# Altium schematic sheet tc264-Main.SchDoc
size A3; SheetNumber: 1; SheetTotal: 3
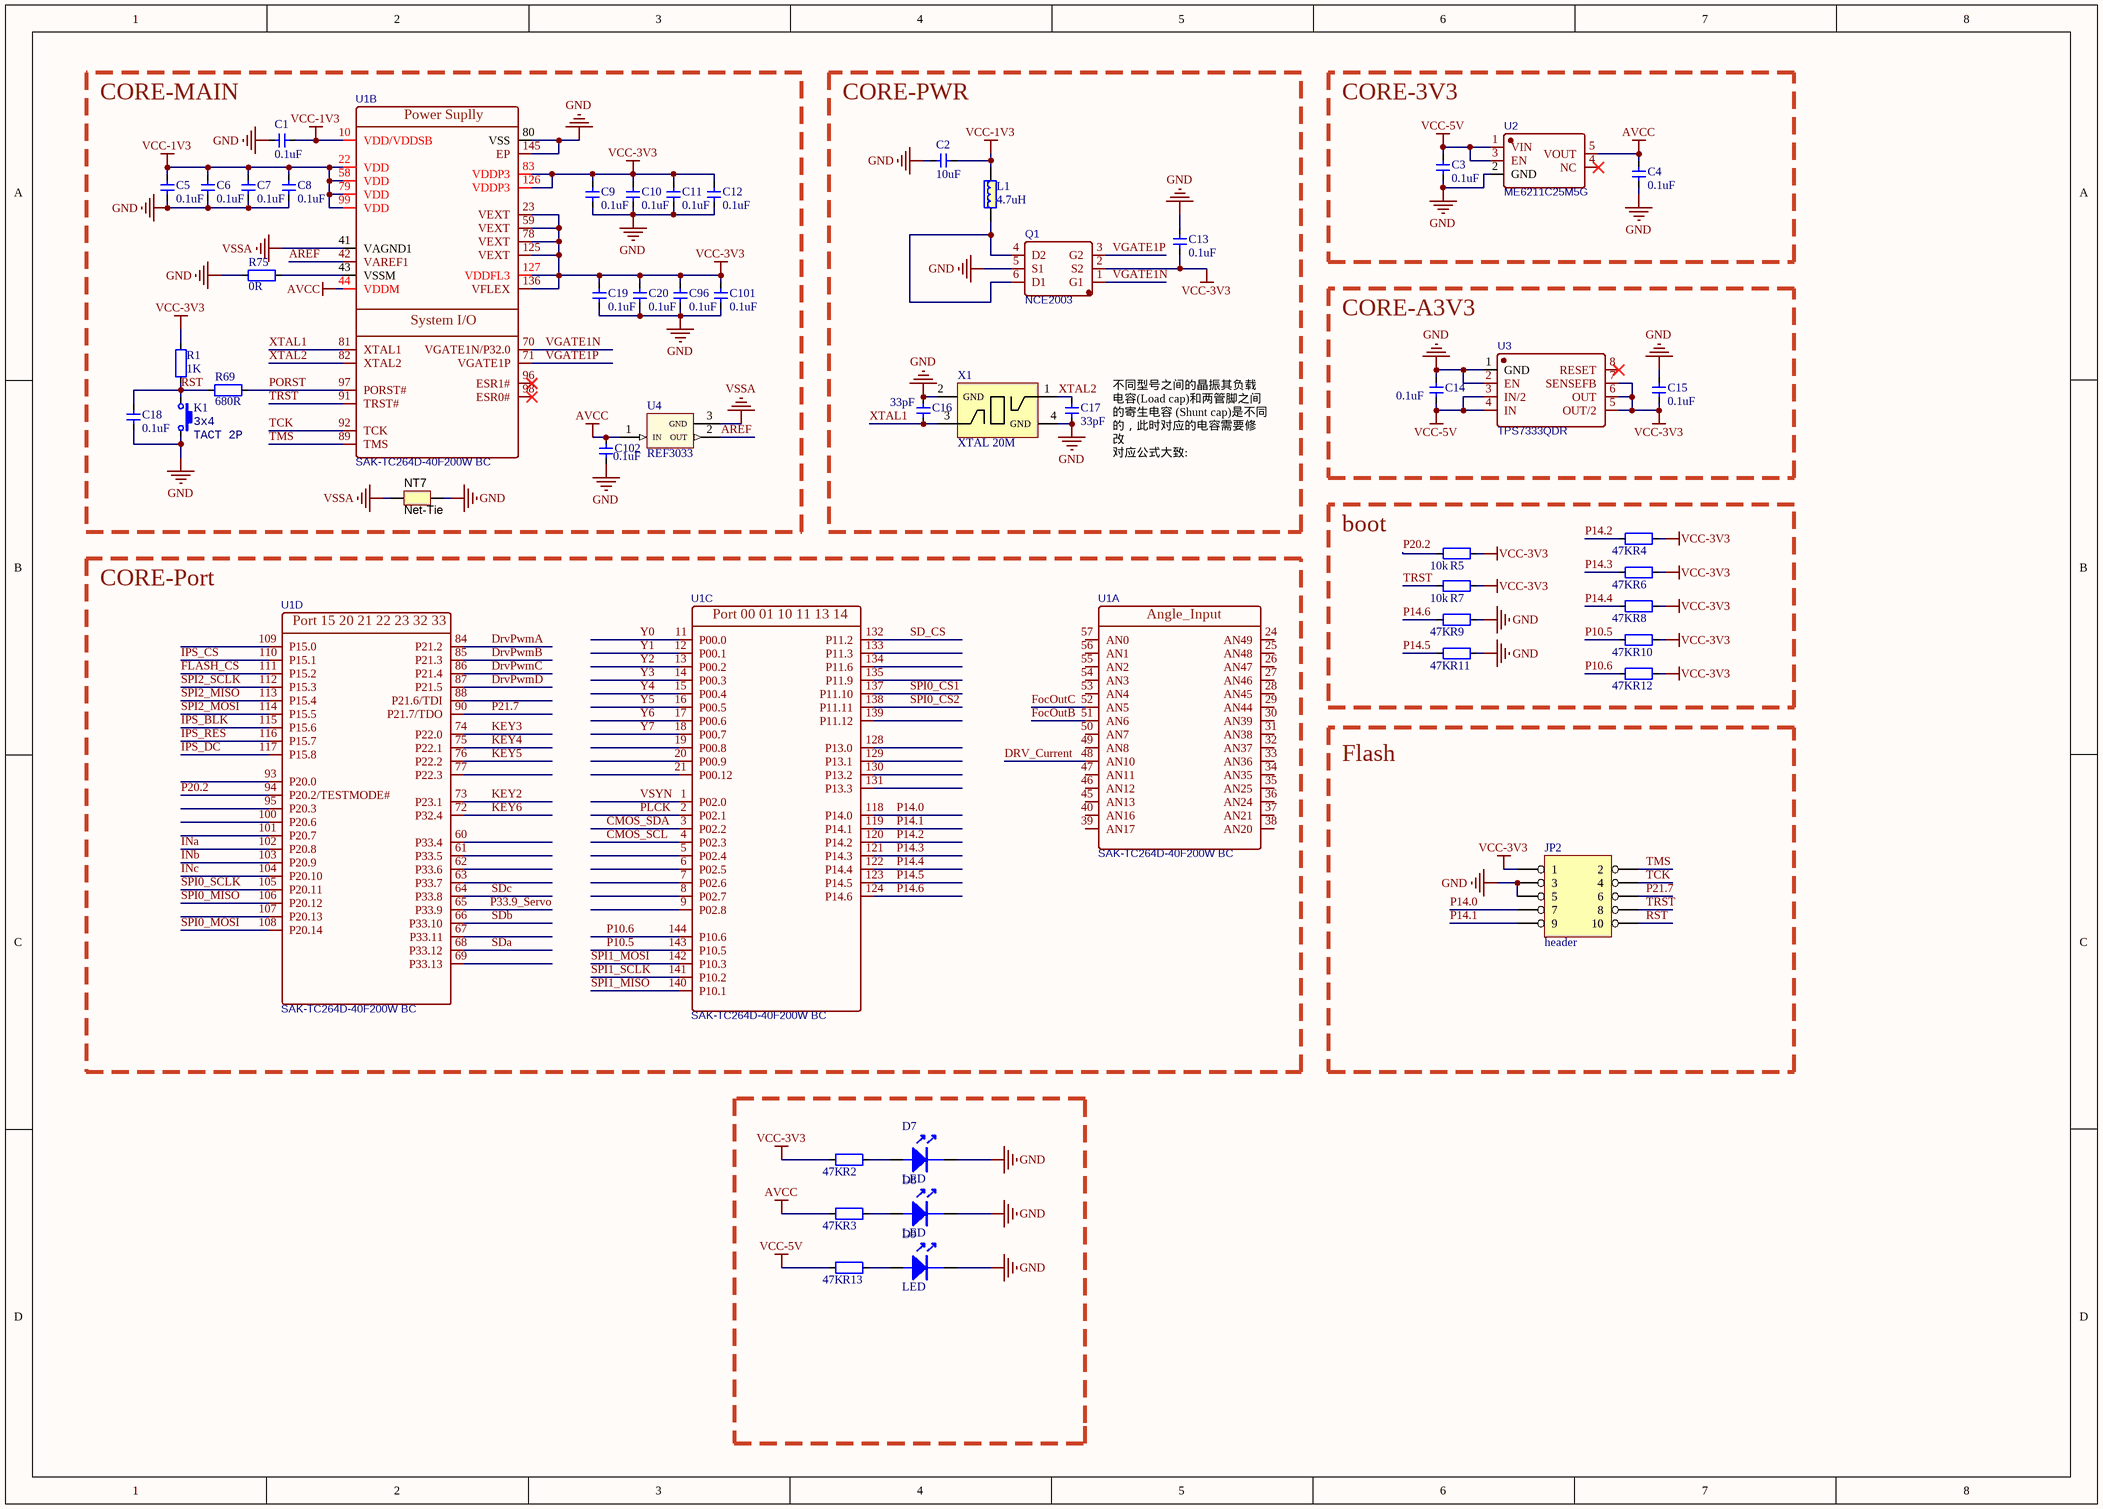
[diagram p0: tc264-Main.SchDoc]

## Parts
C1  0.1uF  [0603-CAP]
C2  10uF  [0603-CAP]
C3  0.1uF  [0603-CAP]
C4  0.1uF  [0603-CAP]
C5  0.1uF  [0603-CAP]
C6  0.1uF  [0603-CAP]
C7  0.1uF  [0603-CAP]
C8  0.1uF  [0603-CAP]
C9  0.1uF  [0603-CAP]
C10  0.1uF  [0603-CAP]
C11  0.1uF  [0603-CAP]
C12  0.1uF  [0603-CAP]
C13  0.1uF  [1206-CAP]
C14  0.1uF  [0603-CAP]
C15  0.1uF  [0603-CAP]
C16  33pF  [0603-CAP]
C17  33pF  [0603-CAP]
C18  0.1uF  [0603-CAP]
C19  0.1uF  [0603-CAP]
C20  0.1uF  [0603-CAP]
C96  0.1uF  [0603-CAP]
C101  0.1uF  [0603-CAP]
C102  0.1uF  [0603-CAP]
D7  LED  [0603_LED]
D8  LED  [0603_LED]
D9  LED  [0603_LED]
JP2  header  [header2X5]
K1  value 3x4  [ButtonTACT_3x4x2_180H]  (hidden comment: TACT 2P)
L1  4.7uH  [IND-201612]
NT7  Net-Tie  [Net-Tie_6mil]  (net tie, no BOM)
Q1  NCE2003  [SOT23-6 - duplicate]
R1  1K  [0603_R]
R2  47K  [0603_R]
R3  47K  [0603_R]
R4  47K  [0603_R]
R5  10k  [0603_R]
R6  47K  [0603_R]
R7  10k  [0603_R]
R8  47K  [0603_R]
R9  47K  [0603_R]
R10  47K  [0603_R]
R11  47K  [0603_R]
R12  47K  [0603_R]
R13  47K  [0603_R]
R69  680R  [0603_R]
R75  0R  [0603_R]
U1  SAK-TC264D-40F200W BC  [EQFP144_M]  (parts A,B,C,D of 4)
U2  ME6211C25M5G  [SOT23-5]
U3  TPS7333QDR  [SOIC-8]
U4  REF3033  [DBZ3]
X1  XTAL 20M  [OSC_KH3225_4P]

## Blocks framed on the sheet
CORE-MAIN: C1 C5-C12 C18-C20 C96 C101 C102 K1 NT7 R1 R69 R75 U1 U4
CORE-PWR: C2 C13 C16 C17 L1 Q1 X1
CORE-3V3: C3 C4 U2
CORE-A3V3: C14 C15 U3
CORE-Port: U1
boot: R4-R12
Flash: JP2

## Nets
AVCC: C4.2 C102.2 R3.2 U1.44(VDDM) U2.5(VOUT) U4.1(IN)
GND: C1.2 C2.2 C3.1 C4.1 C5.1 C6.1 C7.1 C8.1 C9.1 C10.1 C11.1 C12.1 C13.2 C14.2 C15.2 C16.2 C17.1 C18.2 C19.1 C20.1 C96.1 C101.1 C102.1 D7.2(K) D8.2(K) D9.2(K) JP2.3 JP2.5 K1.2 NT7.2 Q1.5(S1) R9.1 R11.1 R75.1 U1.80(VSS) U1.145(EP) U2.2(GND) U3.1(GND) U3.2(EN) X1.2(GND) X1.4(GND)
VCC-1V3: C1.1 C2.1 C5.2 C6.2 C7.2 C8.2 L1.2 U1.10(VDD/VDDSB) U1.22(VDD) U1.58(VDD) U1.79(VDD) U1.99(VDD)
VCC-3V3: C9.2 C10.2 C11.2 C12.2 C13.1 C15.1 C19.2 C20.2 C96.2 C101.2 JP2.1 Q1.2(S2) R1.2 R2.2 R4.1 R5.1 R6.1 R7.1 R8.1 R10.1 R12.1 U1.23(VEXT) U1.59(VEXT) U1.78(VEXT) U1.83(VDDP3) U1.125(VEXT) U1.126(VDDP3) U1.127(VDDFL3) U1.136(VFLEX) U3.5(OUT/2) U3.6(OUT) U3.7(SENSEFB)
VCC-5V: C3.2 C14.1 R13.2 U2.1(VIN) U2.3(EN) U3.3(IN/2) U3.4(IN)
VSSA: NT7.1 U1.41(VAGND1) U4.3(GND)
AREF: U1.42(VAREF1) U4.2(OUT)
CMOS_SCL: U1.4(P02.3)
CMOS_SDA: U1.3(P02.2)
DRV_Current: U1.48(AN10)
DrvPwmA: U1.84(P21.2)
DrvPwmB: U1.85(P21.3)
DrvPwmC: U1.86(P21.4)
DrvPwmD: U1.87(P21.5)
FLASH_CS: U1.111(P15.2)
FocOutB: U1.51(AN6)
FocOutC: U1.52(AN5)
INa: U1.102(P20.8)
INb: U1.103(P20.9)
INc: U1.104(P20.10)
IPS_BLK: U1.115(P15.6)
IPS_CS: U1.110(P15.1)
IPS_DC: U1.117(P15.8)
IPS_RES: U1.116(P15.7)
KEY2: U1.73(P23.1)
KEY3: U1.74(P22.0)
KEY4: U1.75(P22.1)
KEY5: U1.76(P22.2)
KEY6: U1.72(P32.4)
P10.5: R10.2 U1.143(P10.5)
P10.6: R12.2 U1.144(P10.6)
P14.0: JP2.7 U1.118(P14.0)
P14.1: JP2.9 U1.119(P14.1)
P14.2: R4.2 U1.120(P14.2)
P14.3: R6.2 U1.121(P14.3)
P14.4: R8.2 U1.122(P14.4)
P14.5: R11.2 U1.123(P14.5)
P14.6: R9.2 U1.124(P14.6)
P20.2: R5.2 U1.94(P20.2/TESTMODE#)
P21.7: JP2.6 U1.90(P21.7/TDO)
P33.9_Servo: U1.65(P33.9)
PLCK: U1.2(P02.1)
PORST: R69.2 U1.97(PORST#)
RST: C18.1 JP2.10 K1.1 R1.1 R69.1
SD_CS: U1.132(P11.2)
SDa: U1.68(P33.12)
SDb: U1.66(P33.10)
SDc: U1.64(P33.8)
SPI0_CS1: U1.137(P11.10)
SPI0_CS2: U1.138(P11.11)
SPI0_MISO: U1.106(P20.12)
SPI0_MOSI: U1.108(P20.14)
SPI0_SCLK: U1.105(P20.11)
SPI1_MISO: U1.140(P10.1)
SPI1_MOSI: U1.142(P10.3)
SPI1_SCLK: U1.141(P10.2)
SPI2_MISO: U1.113(P15.4)
SPI2_MOSI: U1.114(P15.5)
SPI2_SCLK: U1.112(P15.3)
TCK: JP2.4 U1.92(TCK)
TMS: JP2.2 U1.89(TMS)
TRST: JP2.8 R7.2 U1.91(TRST#)
VGATE1N: Q1.1(G1) U1.70(VGATE1N/P32.0)
VGATE1P: Q1.3(G2) U1.71(VGATE1P)
VSYN: U1.1(P02.0)
XTAL1: C16.1 U1.81(XTAL1) X1.3(OSC2)
XTAL2: C17.2 U1.82(XTAL2) X1.1(OSC1)
Y0: U1.11(P00.0)
Y1: U1.12(P00.1)
Y2: U1.13(P00.2)
Y3: U1.14(P00.3)
Y4: U1.15(P00.4)
Y5: U1.16(P00.5)
Y6: U1.17(P00.6)
Y7: U1.18(P00.7)
NetD7_1: D7.1(A) R2.1
NetD8_1: D8.1(A) R3.1
NetD9_1: D9.1(A) R13.1
NetL1_1: L1.1 Q1.4(D2) Q1.6(D1)
NetR75_2: R75.2 U1.43(VSSM)

Not connected (* = marked no-connect by the designer): U1 5(P02.4) 6(P02.5) 7(P02.6) 8(P02.7) 9(P02.8) 19(P00.8) 20(P00.9) 21(P00.12) 24(AN49) 25(AN48) 26(AN47) 27(AN46) 28(AN45) 29(AN44) 30(AN39) 31(AN38) 32(AN37) 33(AN36) 34(AN35) 35(AN25) 36(AN24) 37(AN21) 38(AN20) 39(AN17) 40(AN16) 45(AN13) 46(AN12) 47(AN11) 49(AN8) 50(AN7) 53(AN4) 54(AN3) 55(AN2) 56(AN1) 57(AN0) 60(P33.4) 61(P33.5) 62(P33.6) 63(P33.7) 67(P33.11) 69(P33.13) 77(P22.3) 88(P21.6/TDI) 93(P20.0) 95(P20.3) 96(ESR1#)* 98(ESR0#)* 100(P20.6) 101(P20.7) 107(P20.13) 109(P15.0) 128(P13.0) 129(P13.1) 130(P13.2) 131(P13.3) 133(P11.3) 134(P11.6) 135(P11.9) 139(P11.12); U2 4(NC)*; U3 8(RESET)*

## Notes on the sheet
- (near C17) 不同型号之间的晶振其负载电容(Load cap)和两管脚之间的寄生电容 (Shunt cap)是不同的，此时对应的电容需要修改
  对应公式大致:
  C = (load cap -shunt cap)/2
  不考虑其他因素
- (in symbol SAK-TC264D-40F200W BC, part A) Angle_Input
- (in symbol SAK-TC264D-40F200W BC, part B) Power Suplly; System I/O
- (in symbol SAK-TC264D-40F200W BC, part C) Port 00 01 10 11 13 14
- (in symbol SAK-TC264D-40F200W BC, part D) Port 15 20 21 22 23 32 33

## Library data of the parts
C1-C20 C96 C101 C102 = 电容-CAP: Capacitor; Value: 0.1u
D7-D9 = LED: LED 发光二极管
JP2 = HEADER 5X2
K1 = KEY3x4x2_180: Button; type: TACT 2P
L1 = 电感-201612
NT7 = Net-Tie: Single point connection between nets.; SymbolCreator: codlsc; SymbolVersion: 2009-07-01; MountType: SMT; Publisher: Texas Instruments; LatestRevisionDate: 2013-04-21; LatestRevisionNote: Added Alternate PartNumber and Alternate Manufacturer parameters to appropriate components.
Q1 = NCE2003: P沟道和N沟道的功率增强MOS管; BOM_Manufacturer: Wuxi NCE Power Semiconductor; Contributor: LCSC; BOM_Supplier: LCSC; BOM_Supplier Part: C216792; BOM_Manufacturer Part: NCE2003; BOM_JLCPCB Part Class: Extended Part; spicePre: Q; spiceSymbolName: NCE2003
R1 = RES: Resistor; Published: 8-Jun-2000; Revision: July-2002: Re-released for DXP Platform.; Publisher: Altium Limited; Value: 1K
R2-R13 R69 R75 = RES: Resistor; Value: 1K; Published: 8-Jun-2000; Revision: July-2002: Re-released for DXP Platform.; Publisher: Altium Limited
U1 = SAK-TC264D-40F200W BC: BOM_Manufacturer: Infineon(英飞凌); Contributor: LCSC; BOM_Supplier: LCSC; BOM_Supplier Part: C538795; BOM_Manufacturer Part: SAK-TC264D-40F200W BC; BOM_JLCPCB Part Class: Extended Part; spicePre: U; spiceSymbolName: SAK-TC264D-40F200W BC
U2 = ME6211C25M5G: BOM_Manufacturer: MICRONE(南京微盟); Contributor: LCSC; BOM_Supplier: LCSC; BOM_Supplier Part: C2835813; BOM_Manufacturer Part: ME6211C25M5G; spicePre: U; spiceSymbolName: ME6211C25M5G
U3 = TPS7333QDR: BOM_Manufacturer: TI; spicePre: X; BOM_Supplier: LCSC; BOM_Manufacturer Part: TPS7333QDR; BOM_Supplier Part: C23791; BOM_JLCPCB Part Class: Extended Part; spiceSymbolName: TPS7333QDR
U4 = REF3033_DBZ_3: Imported; Manufacturer: Texas Instruments; INDUSTRY_STD_PKG_TYPE: SOT-23; FAMILY_NAME: SERIES VOLTAGE REFERENCE; PIN_COUNT: 3; PACKAGE_DESIGNATOR: DBZ; Datasheet URL: http://www.ti.com/lit/gpn/REF3033; GENERIC_PART_NUMBER: REF3033; Vendor: Texas Instruments; Manufacturer_Part_Number: ref3033_dbz_3; RefDes: RefDes; Type: DEV; Value: Value
X1 = XTAL_SMT